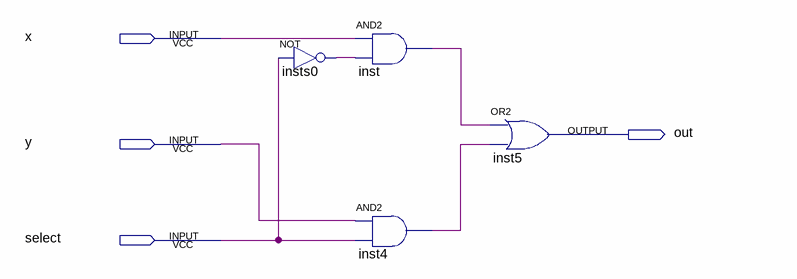
[diagram p0: schematic sheet]
// Quartus schematic selecter.bdf as structural Verilog: 4 symbols, 4 pins
module selecter (
  input  x,
  input  y,
  input  select,
  output out
);

  wire inst4_out, inst_out, insts0_out;

  not insts0 (insts0_out, select);
  and inst (inst_out, x, insts0_out);
  and inst4 (inst4_out, y, select);
  or inst5 (out, inst_out, inst4_out);
endmodule
